# EasyEDA Pro project TEMP_PRO.epro, board PCB_5
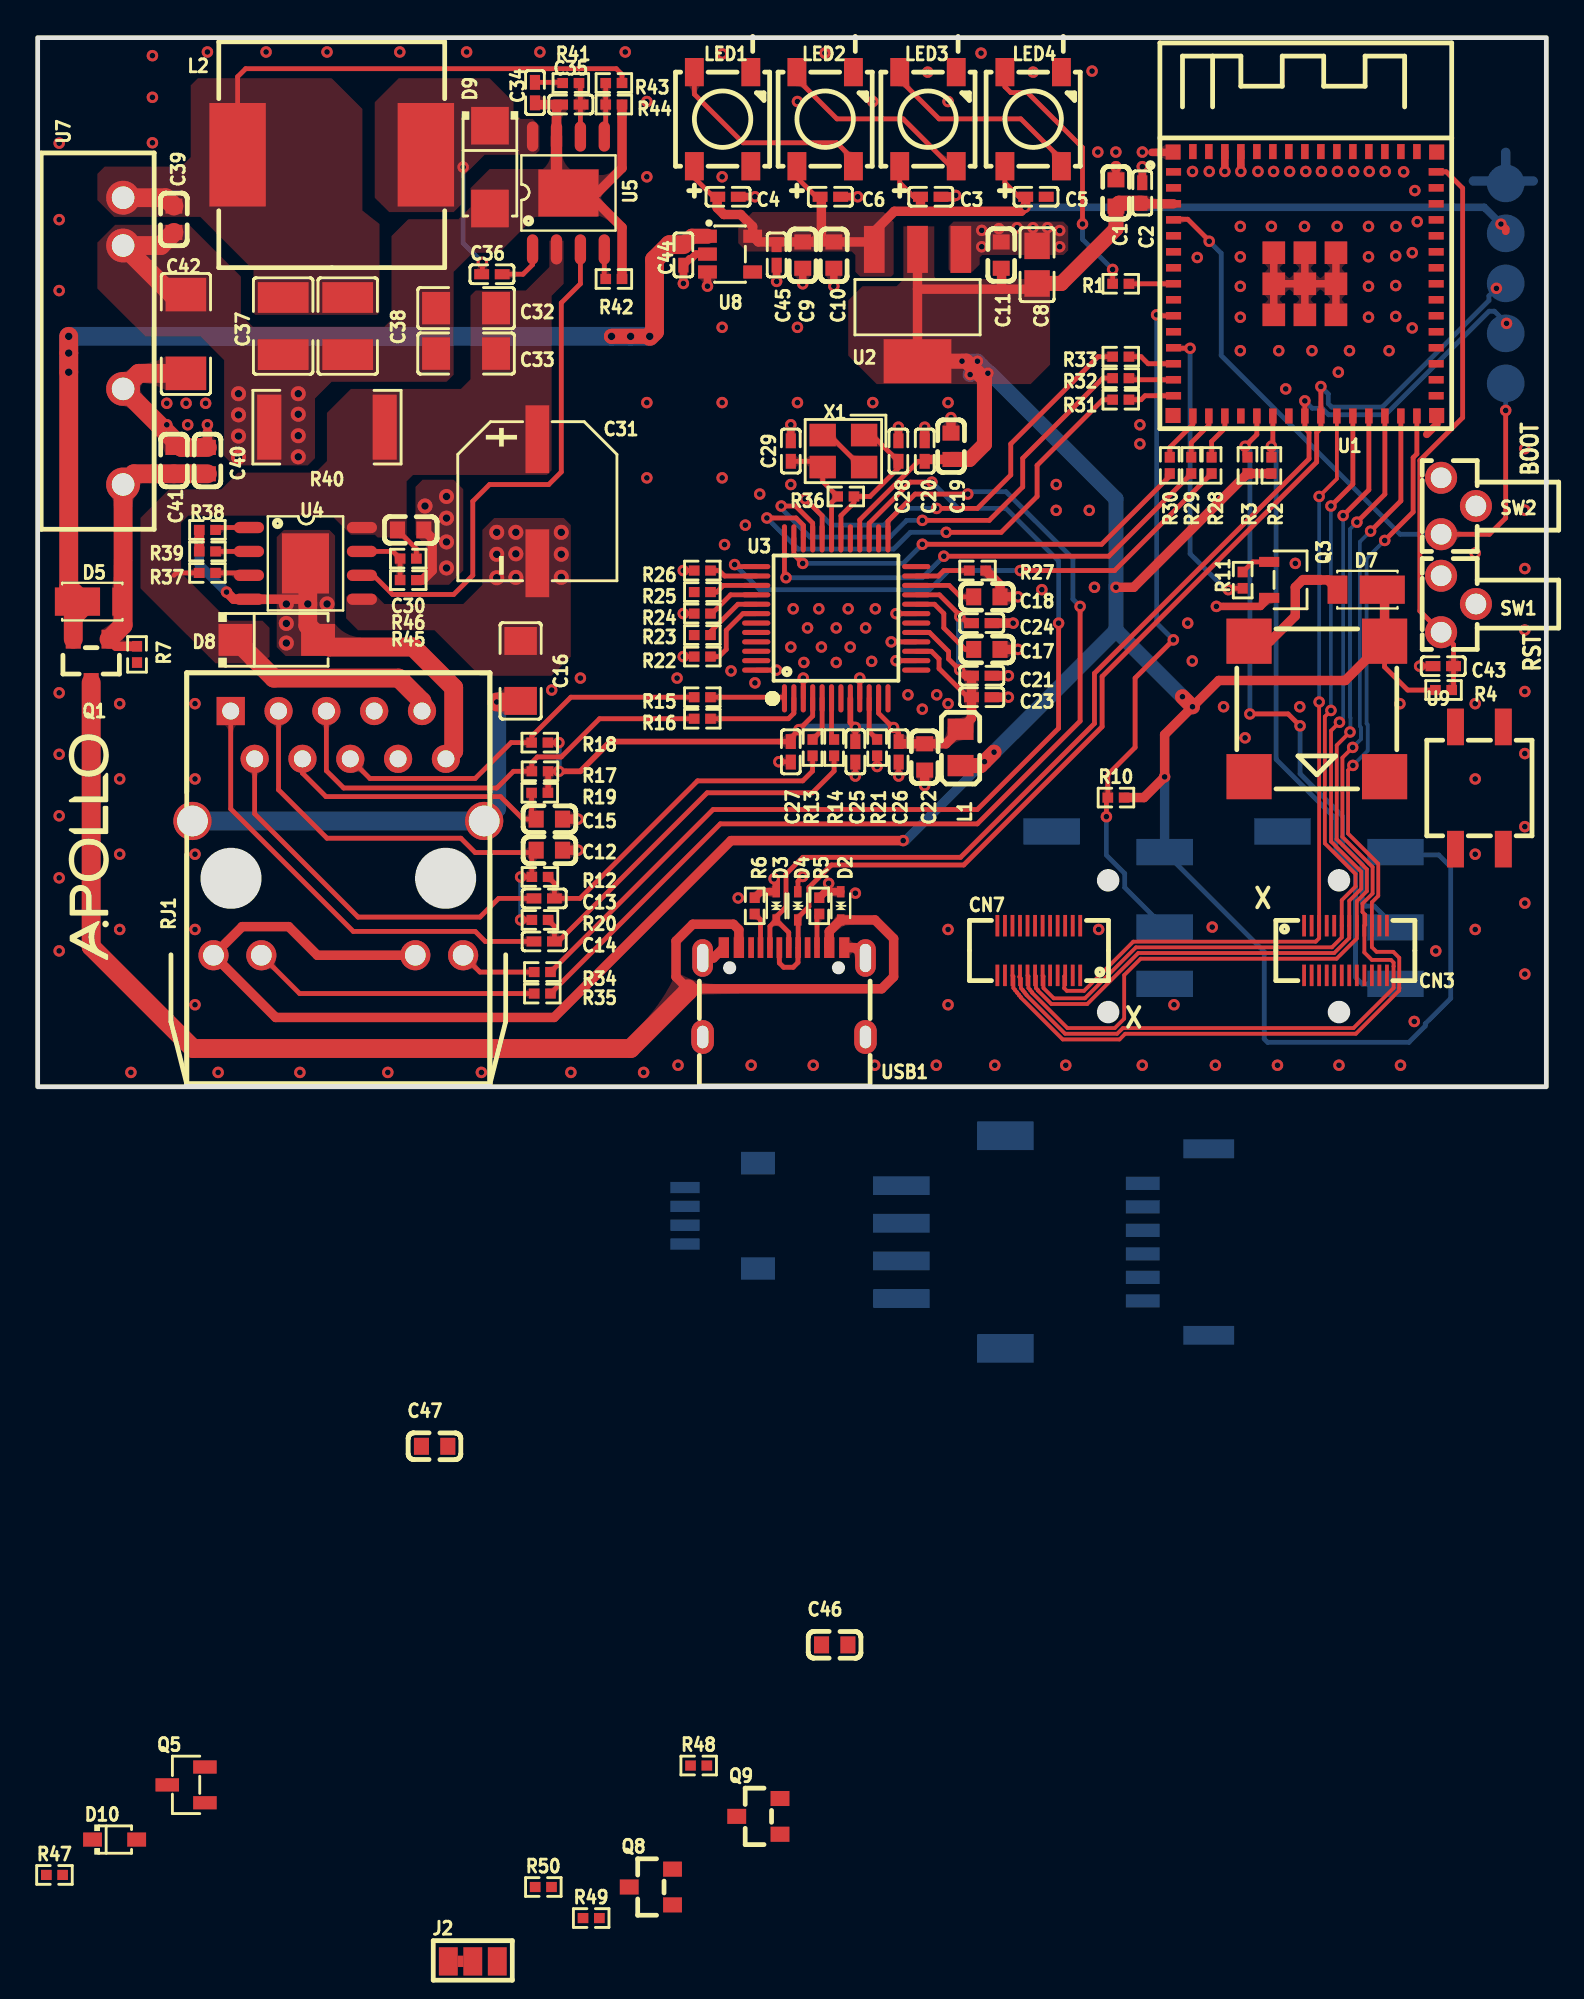
[diagram p3: board, top side]
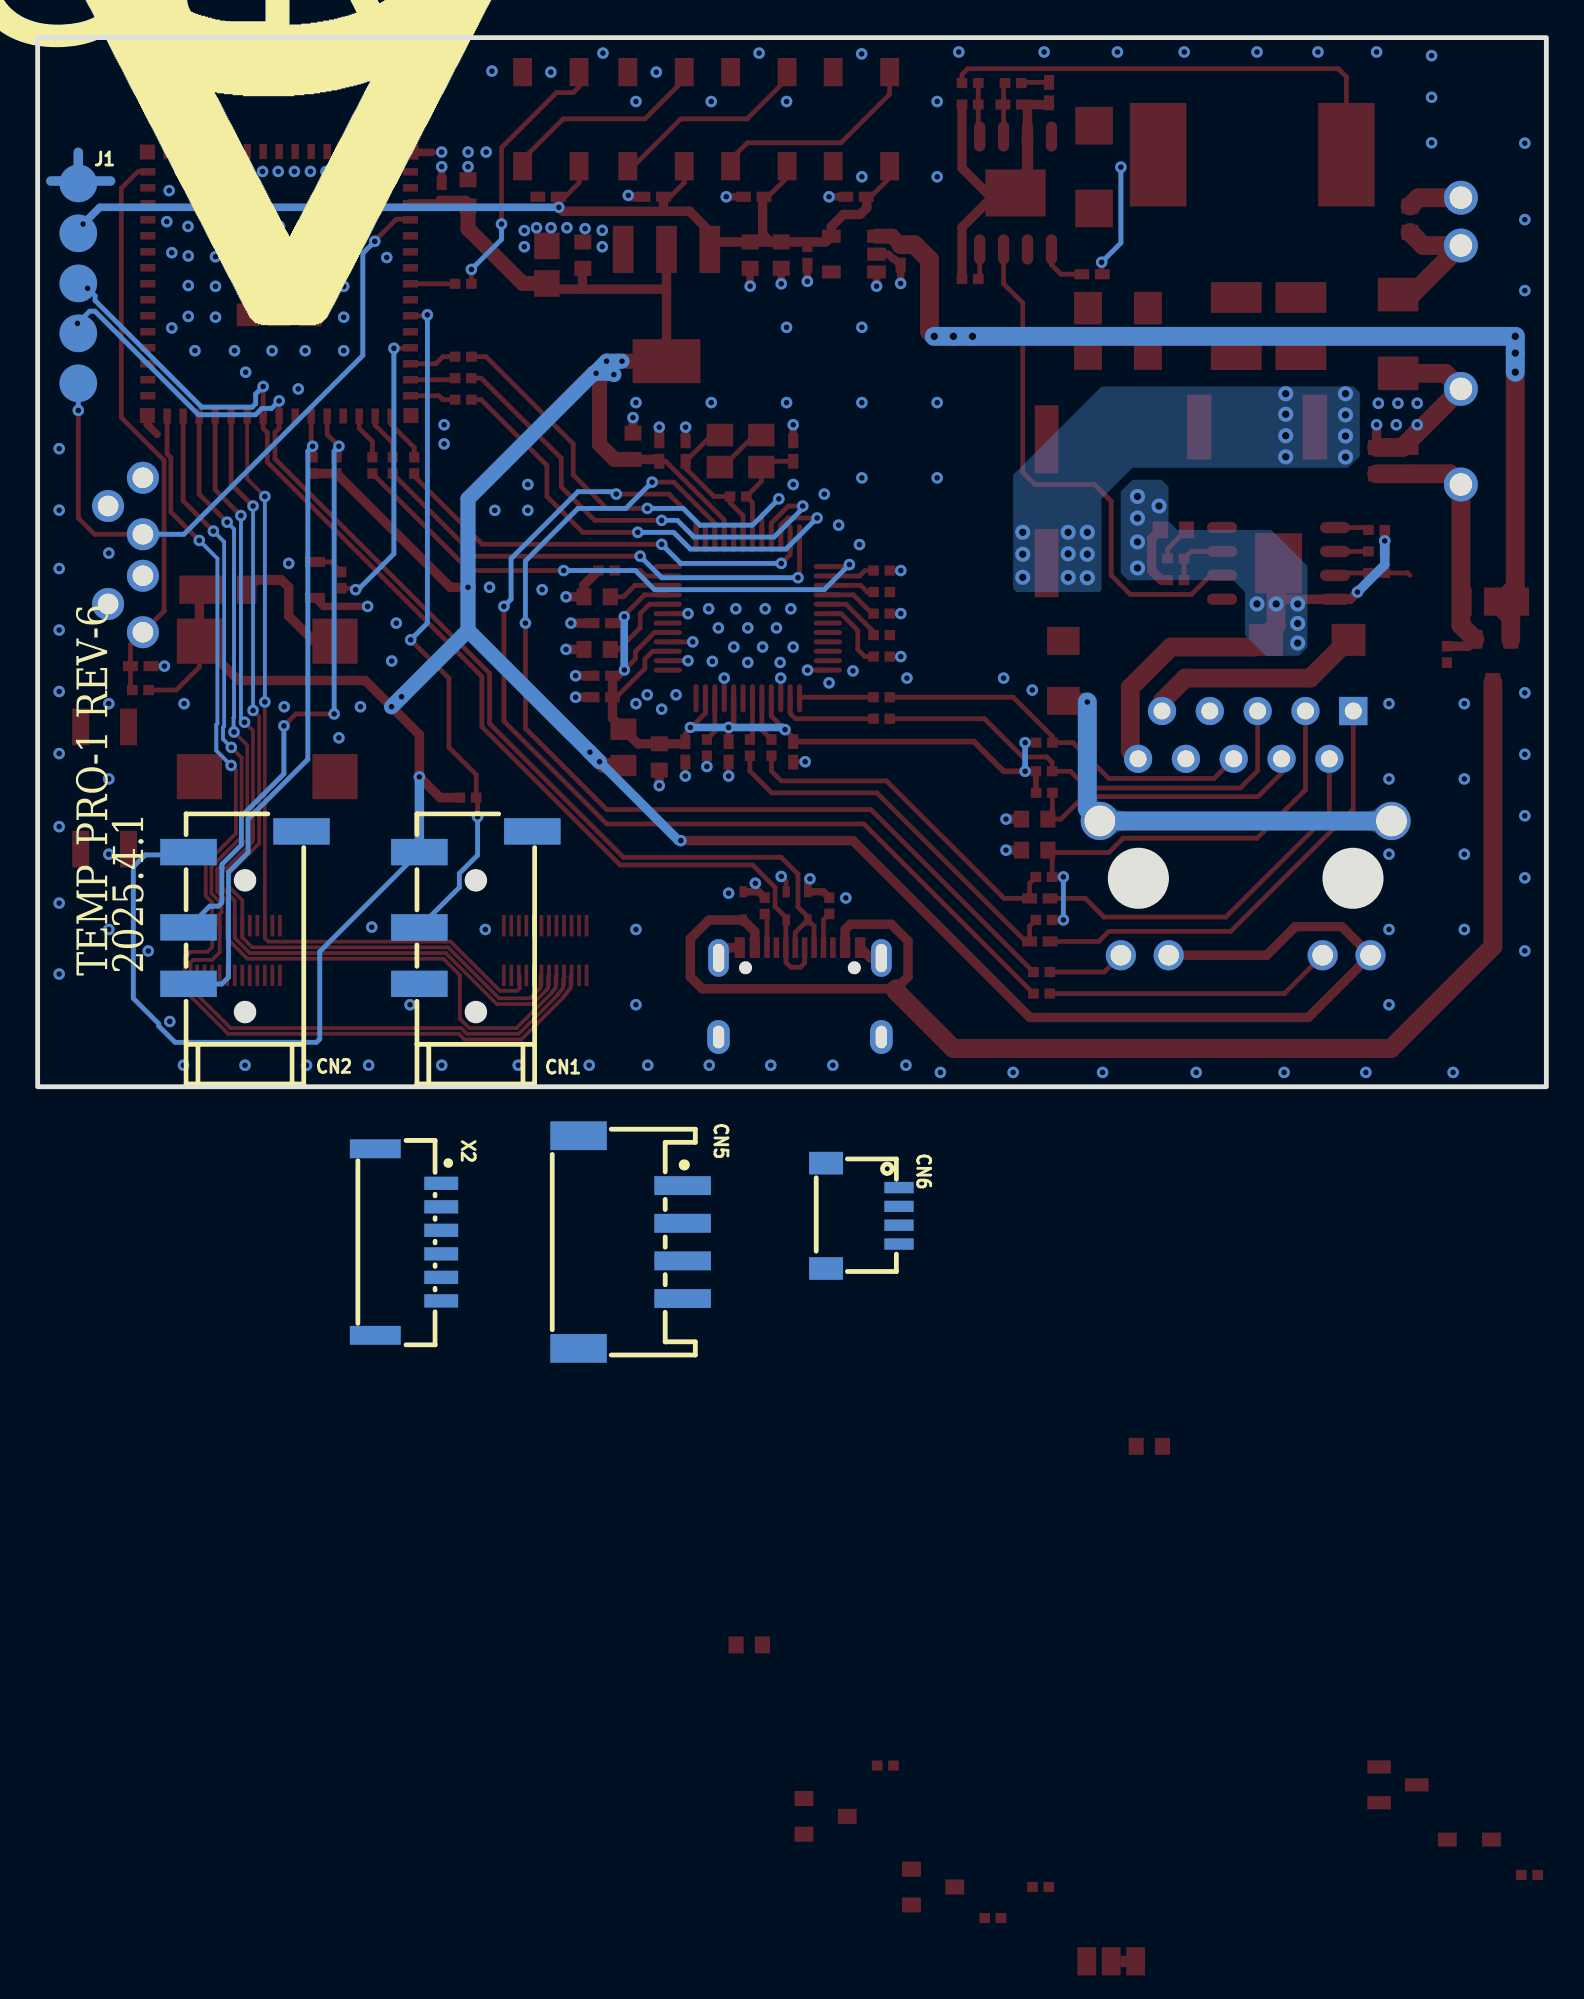
[diagram p4: board, bottom side, seen from below]

Outline 80.14 x 55.75 mm; copper layers: Top Layer, Bottom Layer. Coordinates in mm from the lower left corner of the outline.
Outline path: rectangle 0,55.75 80.14,0
Stack: Top Layer 0.035mm / Dielectric1 1.51mm FR4 er 4.5 / Bottom Layer 0.035mm

## Design rules (mm)
net IO_USBD-: DP1
net IO_USBD+: DP1
template: JLCPCB Capability(Two Layers Board)
spacing copperThickness1oz (default): track to track 0.102, other pairs 0.152 to 0.3
spacing copperThickness2oz: track to track 0.203, other pairs 0.152 to 0.3
track width copperThickness1oz (default): min 0.127, default 0.254, max 2.54
track width copperThickness2oz: min 0.203, default 0.254, max 2.54
differential pair differentialPair (default): width min 0.127, default 0.254, max 2.54; gap min 0.152, default 0.152
via viaSize (default): diameter min 0.5, default 0.61, max 10; hole min 0.3, default 0.305, max 6.3

## Placement (name value [footprint] x y rotation side)
BUZZER1  2700Hz  [BUZ-SMD_4P-L8.5-W8.5-P8.50-BR]  67.94 20.08 180 top
C1  10uF  [C0603]  57.28 47.5 270 top
C2  100nF  [C0402]  58.67 47.5 270 top
C3  100nF  [C0402]  47.44 47.3 0 top
C4  100nF  [C0402]  36.67 47.3 0 top
C5  100nF  [C0402]  53.03 47.3 0 top
C6  100nF  [C0402]  42.1 47.3 0 top
C8  22uF  [C0805]  53.09 43.69 270 top
C9  10uF  [C0603]  40.64 44.2 90 top
C10  10uF  [C0603]  42.29 44.2 90 top
C11  10uF  [C0603]  51.18 44.2 270 top
C12  10nF  [C0603]  27.18 12.57 180 top
C13  6.8nF  [C0402]  26.91 10.01 180 top
C14  6.8nF  [C0402]  26.91 7.72 180 top
C15  22nF  [C0603]  27.18 14.22 180 top
C16  1nF  [C1206]  25.65 22.1 90 top
C17  4.7uF  [C0603]  50.42 23.24 180 top
C18  10nF  [C0603]  50.42 26.03 180 top
C19  10uF  [C0603]  48.51 34.04 270 top
C20  100nF  [C0402]  47.12 33.78 270 top
C21  100nF  [C0402]  50.15 21.84 180 top
C22  10uF  [C0603]  47.12 17.53 90 top
C23  100nF  [C0402]  50.15 20.7 180 top
C24  100nF  [C0402]  50.15 24.64 180 top
C25  100nF  [C0402]  43.43 17.8 90 top
C26  100nF  [C0402]  45.73 17.8 90 top
C27  100nF  [C0402]  40 17.8 90 top
C28  18pF  [C0402]  45.72 33.78 270 top
C29  18pF  [C0402]  40 33.78 270 top
C30  100nF  [C0603]  19.81 29.59 180 top
C31  22uF  [CAP-SMD_BD8.0-L8.3-W8.3-RD]  26.54 31.11 90 top
C32  2.2uF  [C1206]  22.76 41.38 0 top
C33  2.2uF  [C1206]  22.76 38.96 0 top
C34  10nF  [C0402]  26.42 52.83 90 top
C35  8.2pF  [C0402]  28.32 52.2 0 top
C36  100nF  [C0402]  24.13 43.18 0 top
C37  47uF  [C1210]  13.04 40.43 90 top
C38  47uF  [C1210]  16.47 40.43 90 top
C39  10uF  [C0603]  7.24 46.1 90 top
C40  10uF  [C0603]  9.02 33.27 270 top
C41  10uF  [C0603]  7.24 33.27 270 top
C42  1nF  [C1808]  7.87 40 270 top
C43  1uF  [C0402]  74.66 22.35 0 top
C44  1uF  [C0402]  34.3 44.2 90 top
C45  1uF  [C0402]  39.25 44.2 90 top
C46  100nF  [C0603]  42.34 -29.66 0 top
C47  100nF  [C0603]  21.09 -19.11 0 top
CN1  PJ-320D  [AUDIO-SMD_PJ-320D]  56.86 9.52 0 bottom
CN2  PJ-320D  [AUDIO-SMD_PJ-320D]  69.12 9.52 0 bottom
CN3  DF40C-24DS-0.4V(51)  [CONN-SMD_DF40C-24DS-0.4V51]  69.47 7.24 180 top
CN5  PH2.0-4PWB-WT  [CONN-SMD_2.0-4PWB-WT]  48.64 -8.26 270 bottom
CN6  SM04B-SRSS-TB(LF)(SN)  [CONN-SMD_4P-P1.00_SM04B-SRSS-TB-LF-SN]  36.32 -6.86 270 bottom
CN7  DF40C-24DS-0.4V(51)  [CONN-SMD_DF40C-24DS-0.4V51]  53.18 7.24 0 top
D2  LESD5D5.0CT1G  [SOD-523_L1.2-W0.8-LS1.6-BI]  42.66 9.61 90 top
D3  LESD5D5.0CT1G  [SOD-523_L1.2-W0.8-LS1.6-BI]  39.23 9.61 90 top
D4  LESD5D5.0CT1G  [SOD-523_L1.2-W0.8-LS1.6-BI]  40.37 9.61 90 top
D5  DFLS130L-7  [POWERDI-123_L2.8-W1.8-LS3.7-RD]  3.3 25.78 0 top
D7  DFLS130L-7  [POWERDI-123_L2.8-W1.8-LS3.7-RD]  70.23 26.42 180 top
D8  SMAJ58A-13-F  [SMA_L4.4-W2.6-LS5.0-RD]  12.7 23.75 0 top
D9  SS510  [SMA_L4.3-W2.6-LS5.2-RD]  24.03 48.87 270 top
D10  CUS10S30,H3F  [SOD-323_L1.8-W1.3-LS2.5-RD]  4.09 -40.01 0 top
J1  -  [Programming Pads]  77.98 48.01 180 bottom
J2  -  [Jumper:SolderJumper-3_P1.3mm_Bridged12_Pad1.0x1.5mm]  23.11 -46.48 0 top
L1  UPZ2012E601-2R0TF  [L0805]  49.02 18.03 90 top
L2  18uH  [IND-SMD_L12.0-W12.0_CDRH127NP]  15.62 49.53 180 top
LED1  XL-5050RGBC-WS2812B  [LED-SMD_4P-L5.0-W5.0-BL_XL-5050RGBC]  36.38 51.42 0 top
LED2  XL-5050RGBC-WS2812B  [LED-SMD_4P-L5.0-W5.0-BL_XL-5050RGBC]  41.83 51.42 0 top
LED3  XL-5050RGBC-WS2812B  [LED-SMD_4P-L5.0-W5.0-BL_XL-5050RGBC]  47.29 51.42 0 top
LED4  XL-5050RGBC-WS2812B  [LED-SMD_4P-L5.0-W5.0-BL_XL-5050RGBC]  52.88 51.42 0 top
Q1  SI2333CDS-T1-GE3  [SOT-23_L2.9-W1.3-P1.90-LS2.4-BR]  2.84 22.63 90 top
Q3  BC817  [SOT-23-3_L2.9-W1.4-P1.91-LS2.6-BR]  66.55 26.94 180 top
Q5  CJ2321  [SOT-23-3_L2.9-W1.3-P1.90-LS2.4-BR]  7.88 -37.1 0 top
Q8  2N7002,215  [SOT-23_L2.9-W1.3-P1.90-LS2.4-BR]  32.57 -42.53 0 top
Q9  SI2333CDS-T1-GE3  [SOT-23_L2.9-W1.3-P1.90-LS2.4-BR]  38.28 -38.77 0 top
R1  470Ω  [R0402]  57.53 42.67 0 top
R2  4.7kΩ  [R0402]  65.53 33.02 90 top
R3  4.7kΩ  [R0402]  64.26 33.02 90 top
R4  10kΩ  [R0402]  74.68 21.08 180 top
R5  5.1kΩ  [R0402]  41.52 9.61 270 top
R6  5.1kΩ  [R0402]  38.09 9.61 270 top
R7  10kΩ  [R0402]  5.28 22.98 90 top
R10  4.7kΩ  [R0402]  57.28 15.37 0 top
R11  330Ω  [R0402]  64.01 26.92 270 top
R12  49.9Ω  [R0402]  26.68 11.15 0 top
R13  33Ω  [R0402]  41.16 18.02 90 top
R14  33Ω  [R0402]  42.3 18.02 90 top
R15  33Ω  [R0402]  35.31 20.7 0 top
R16  33Ω  [R0402]  35.31 19.56 0 top
R17  49.9Ω  [R0402]  26.68 16.76 0 top
R18  49.9Ω  [R0402]  26.67 18.29 0 top
R19  10Ω  [R0402]  26.67 15.62 0 top
R20  49.9Ω  [R0402]  26.68 8.86 0 top
R21  12.4kΩ  [R0402]  44.59 18.02 90 top
R22  10kΩ  [R0402]  35.31 22.86 180 top
R23  10kΩ  [R0402]  35.31 24 180 top
R24  10kΩ  [R0402]  35.31 25.15 180 top
R25  10kΩ  [R0402]  35.31 26.29 180 top
R26  10kΩ  [R0402]  35.31 27.43 180 top
R27  10kΩ  [R0402]  49.92 27.43 180 top
R28  22Ω  [R0402]  62.36 33.02 90 top
R29  22Ω  [R0402]  61.28 33.02 90 top
R30  22Ω  [R0402]  60.13 33.02 90 top
R31  22Ω  [R0402]  57.53 36.51 0 top
R32  22Ω  [R0402]  57.53 37.66 0 top
R33  22Ω  [R0402]  57.53 38.8 0 top
R34  470Ω  [R0402]  26.81 6.1 180 top
R35  470Ω  [R0402]  26.81 4.95 180 top
R36  1MΩ  [R0402]  42.93 31.37 180 top
R37  24.9kΩ  [R0402]  9.02 27.3 180 top
R38  180kΩ  [R0402]  9.02 29.59 0 top
R39  4.42kΩ  [R0402]  9.02 28.45 0 top
R40  4.7kΩ  [R2512]  15.37 35.05 180 top
R41  18.7kΩ  [R0402]  28.32 53.34 0 top
R42  274kΩ  [R0402]  30.61 42.93 180 top
R43  60.4kΩ  [R0402]  30.61 53.34 180 top
R44  11.5kΩ  [R0402]  30.61 52.2 180 top
R45  10kΩ  [R0402]  19.69 26.92 180 top
R46  130kΩ  [R0402]  19.69 28.07 0 top
R47  10kΩ  [R0402]  0.89 -41.89 0 top
R48  100kΩ  [R0402]  35.11 -36.07 0 top
R49  100kΩ  [R0402]  29.4 -44.18 0 top
R50  10Ω  [R0402]  26.86 -42.53 0 top
RJ1  HY931147C  [RJ45-TH_HY931147C]  15.97 13.48 90 top
SW1  TSC017A07026A  [SW-TH_3P-L4.5-W7.0-P3.00-LS1.9]  75.47 25.65 90 top
SW2  TSC017A07026A  [SW-TH_3P-L4.5-W7.0-P3.00-LS1.9]  75.47 30.86 90 top
U1  2.4GHz  [BULETM-SMD_ESP32-S3-MINI-1-N8]  67.31 42.67 0 top
U2  AZ1117H-3.3TRE1  [SOT-223-3_L6.5-W3.4-P2.30-LS7.0-BR]  46.74 41.53 90 top
U3  W5500  [LQFP-48_L7.0-W7.0-P0.50-LS9.0-BL]  42.42 24.89 0 top
U4  TPS2376DDAR-H  [SO-8_L4.9-W3.9-P1.27-LS6.0-BL-EP]  14.22 27.81 270 top
U5  TPS54560BDDAR  [POWERPAD-SO-8_L4.9-W3.9-P1.27-LS6.0-BL-EP]  28.19 47.5 0 top
U7  F0505S-2WR2  [PWRM-TH_FXXXXS-1WR2]  4.54 39.63 270 top
U8  NCV360SNT1G  [TSOP-5_L3.0-W1.5-P0.95-LS2.8-BL]  36.78 44.25 270 top
U9  HC-PM254-8.5H-2x2PS  [HDR-SMD_4P-P2.54-V-F-R2-C2-LS6.8]  76.58 15.87 0 top
USB1  TYPE-C16PIN2MD(073)  [USB-C-SMD_TYPE-C-6PIN-2MD-073]  39.65 5.02 0 top
X1  25MHz  [CRYSTAL-SMD_4P-L3.2-W2.5-BL]  42.8 33.78 180 top
X2  GH125-S06DCA-00  [CONN-SMD_6P-P1.25_JUSHUO_GH125-S06DCA-00]  60.45 -8.26 270 bottom

## Footprints (pads in the part's own frame, mm; a bottom-side part is the same pattern mirrored in y, then rotated)
AUDIO-SMD_PJ-320D
  rect 3x1.4 smd: 1(-3,-4.05) 2(3,4.05) 3(3,1.05) 4(3,-2.95)
BULETM-SMD_ESP32-S3-MINI-1-N8
  rect 0.8x0.4 smd: 1(-6.975,5.95) 2(-6.975,5.1) 3(-6.975,4.25) 4(-6.975,3.4) 5(-6.975,2.55) 6(-6.975,1.7) 7(-6.975,0.85) 8(-6.975,0) 9(-6.975,-0.85) 10(-6.975,-1.7) 11(-6.975,-2.55) 12(-6.975,-3.4) 13(-6.975,-4.25) 14(-6.975,-5.1) 15(-6.975,-5.95) 31(6.975,-5.95) 32(6.975,-5.1) 33(6.975,-4.25) 34(6.975,-3.4) 35(6.975,-2.55) 36(6.975,-1.7) 37(6.975,-0.85) 38(6.975,0) 39(6.975,0.85) 40(6.975,1.7) 41(6.975,2.55) 42(6.975,3.4) 43(6.975,4.25) 44(6.975,5.1) 45(6.975,5.95)
  rect 0.4x0.8 smd: 16(-5.95,-7.025) 17(-5.1,-7.025) 18(-4.25,-7.025) 19(-3.4,-7.025) 20(-2.55,-7.025) 21(-1.7,-7.025) 22(-0.85,-7.025) 23(0,-7.025) 24(0.85,-7.025) 25(1.7,-7.025) 26(2.55,-7.025) 27(3.4,-7.025) 28(4.25,-7.025) 29(5.1,-7.025) 30(5.95,-7.025) 46(5.95,7.025) 47(5.1,7.025) 48(4.25,7.025) 49(3.4,7.025) 50(2.55,7.025) 51(1.7,7.025) 52(0.85,7.025) 53(0,7.025) 54(-0.85,7.025) 55(-1.7,7.025) 56(-2.55,7.025) 57(-3.4,7.025) 58(-4.25,7.025) 59(-5.1,7.025) 60(-5.95,7.025)
  rect 0.8x0.8 smd: GND(-7,7) GND(-7,-7) GND(7,7) GND(7,-7)
  rect 1.2x1.2 smd: GND(-1.65,1.65) GND(-1.65,0) GND(-1.65,-1.65) GND(0,1.65) GND(0,0) GND(0,-1.65) GND(1.65,1.65) GND(1.65,0) GND(1.65,-1.65)
BUZ-SMD_4P-L8.5-W8.5-P8.50-BR
  rect 2.4x2.4 smd: 1(-3.6,-3.6) 2(3.6,-3.6) 3(3.599,3.599) 4(-3.6,3.6)
C0402
  rect 0.79x0.54 smd: 1(-0.545,0) 2(0.545,0)
C0603
  rect 0.8x0.9 smd: 1(-0.7,0) 2(0.7,0)
C0805
  rect 1.41x1.35 smd: 1(-1,0) 2(1,0)
C1206
  rect 1.485x1.728 smd: 1(-1.593,0) 2(1.593,0)
C1210
  rect 1.635x2.7 smd: 1(-1.518,0) 2(1.518,0)
C1808
  rect 1.785x2.16 smd: 1(-2.092,0) 2(2.092,0)
CAP-SMD_BD8.0-L8.3-W8.3-RD
  rect 3.61x1.26 smd: 1(3.295,0) 2(-3.295,0)
CONN-SMD_2.0-4PWB-WT
  rect 1x3 smd: 1(-3,2.763) 2(-1,2.763) 3(1,2.763) 4(3,2.763)
  rect 1.524x3 smd: 5(-5.65,-2.763) 6(5.65,-2.763)
CONN-SMD_4P-P1.00_SM04B-SRSS-TB-LF-SN
  rect 0.6x1.55 smd: 1(-1.5,1.938) 2(-0.5,1.938) 3(0.5,1.938) 4(1.5,1.938)
  rect 1.2x1.8 smd: 5(2.8,-1.938) 6(-2.8,-1.938)
CONN-SMD_6P-P1.25_JUSHUO_GH125-S06DCA-00
  rect 0.7x1.8 smd: 1(-3.125,1.75) 2(-1.875,1.75) 3(-0.625,1.75) 4(0.625,1.75) 5(1.875,1.75) 6(3.125,1.75)
  rect 1x2.7 smd: 7(4.955,-1.75) 8(-4.955,-1.75)
CONN-SMD_DF40C-24DS-0.4V51
  rect 0.2x1.14 smd: 1(2.2,-1.32) 2(2.2,1.32) 3(1.8,-1.32) 4(1.8,1.32) 5(1.4,-1.32) 6(1.4,1.32) 7(1,-1.32) 8(1,1.32) 9(0.6,-1.32) 10(0.6,1.32) 11(0.2,-1.32) 12(0.2,1.32) 13(-0.2,-1.32) 14(-0.2,1.32) 15(-0.6,-1.32) 16(-0.6,1.32) 17(-1,-1.32) 18(-1,1.32) 19(-1.4,-1.32) 20(-1.4,1.32) 21(-1.8,-1.32) 22(-1.8,1.32) 23(-2.2,-1.32) 24(-2.2,1.32)
CRYSTAL-SMD_4P-L3.2-W2.5-BL
  rect 1.4x1.2 smd: 1(-1.1,-0.85) 2(1.1,-0.85) 3(1.1,0.85) 4(-1.1,0.85)
HDR-SMD_4P-P2.54-V-F-R2-C2-LS6.8
  rect 0.9x1.945 smd: 1(-1.27,-3.248) 2(-1.27,3.248) 3(1.27,-3.248) 4(1.27,3.248)
IND-SMD_L12.0-W12.0_CDRH127NP
  rect 3x5.5 smd: 1(-5,0) 2(5,0)
Jumper:SolderJumper-3_P1.3mm_Bridged12_Pad1.0x1.5mm
  custom 0.3x0.6 smd: (-0.65,0)
  custom 1x1.5 smd: 1(-1.3,0) 2(0,0) 3(1.3,0)
L0805
  rect 1.133x1.377 smd: 1(-0.966,0) 2(0.966,0)
LED-SMD_4P-L5.0-W5.0-BL_XL-5050RGBC
  rect 1x1.5 smd: 1(-1.5,-2.5) 2(1.5,-2.5) 3(1.5,2.5) 4(-1.5,2.5)
LQFP-48_L7.0-W7.0-P0.50-LS9.0-BL
  oval 0.27x1.5 smd: 1(-2.75,-4.25) 2(-2.25,-4.25) 3(-1.75,-4.25) 4(-1.25,-4.25) 5(-0.75,-4.25) 6(-0.25,-4.25) 7(0.25,-4.25) 8(0.75,-4.25) 9(1.25,-4.25) 10(1.75,-4.25) 11(2.25,-4.25) 12(2.75,-4.25) 25(2.75,4.25) 26(2.25,4.25) 27(1.75,4.25) 28(1.25,4.25) 29(0.75,4.25) 30(0.25,4.25) 31(-0.25,4.25) 32(-0.75,4.25) 33(-1.25,4.25) 34(-1.75,4.25) 35(-2.25,4.25) 36(-2.75,4.25)
  oval 1.5x0.27 smd: 13(4.25,-2.75) 14(4.25,-2.25) 15(4.25,-1.75) 16(4.25,-1.25) 17(4.25,-0.75) 18(4.25,-0.25) 19(4.25,0.25) 20(4.25,0.75) 21(4.25,1.25) 22(4.25,1.75) 23(4.25,2.25) 24(4.25,2.75) 37(-4.25,2.75) 38(-4.25,2.25) 39(-4.25,1.75) 40(-4.25,1.25) 41(-4.25,0.75) 42(-4.25,0.25) 43(-4.25,-0.25) 44(-4.25,-0.75) 45(-4.25,-1.25) 46(-4.25,-1.75) 47(-4.25,-2.25) 48(-4.25,-2.75)
POWERDI-123_L2.8-W1.8-LS3.7-RD
  rect 2.4x1.5 smd: 1(-1.188,0)
  rect 1.05x1.5 smd: 2(1.188,0)
POWERPAD-SO-8_L4.9-W3.9-P1.27-LS6.0-BL-EP
  oval 0.6x1.6 smd: 1(-1.905,-3) 2(-0.635,-3) 3(0.635,-3) 4(1.905,-3) 5(1.905,3) 6(0.635,3) 7(-0.635,3) 8(-1.905,3)
  rect 3.2x2.5 smd: 9(0,0)
Programming Pads
  round 2 smd: 1(0,0) 2(0,-2.653) 3(0,-5.312) 4(0,-7.968) 5(0,-10.624)
PWRM-TH_FXXXXS-1WR2
  round 1.8 hole 1.2: 1(-7.62,0) 2(-5.08,0) 5(2.54,0) 7(7.62,0)
R0402
  rect 0.566x0.54 smd: 1(-0.433,0) 2(0.433,0)
R2512
  rect 1.282x3.456 smd: 1(-3.067,0) 2(3.067,0)
RJ45-TH_HY931147C
  rect 1.5x1.5 hole 0.9: 1(6.489,5.715)
  round 1.5 hole 0.9: 2(3.95,4.445) 3(6.489,3.175) 4(3.95,1.905) 5(6.489,0.635) 6(3.95,-0.635) 7(6.489,-1.905) 8(3.95,-3.175) 9(6.489,-4.445) 10(3.95,-5.715)
  round 1.6 hole 1.1: 11(-6.489,6.63) 12(-6.489,4.09) 13(-6.489,-4.09) 14(-6.489,-6.63)
  round 2.03 hole 1.631: GND1(0.647,7.747) GND2(0.647,-7.747)
SMA_L4.3-W2.6-LS5.2-RD
  rect 2x2 smd: 1(-2.2,0) 2(2.2,0)
SMA_L4.4-W2.6-LS5.0-RD
  rect 1.8x1.7 smd: 1(-2.192,0) 2(2.192,0)
SO-8_L4.9-W3.9-P1.27-LS6.0-BL-EP
  oval 0.6x1.6 smd: 1(-1.905,-3) 2(-0.635,-3) 3(0.635,-3) 4(1.905,-3) 5(1.905,3) 6(0.635,3) 7(-0.635,3) 8(-1.905,3)
  rect 3.2x2.5 smd: 9(0,0)
SOD-323_L1.8-W1.3-LS2.5-RD
  rect 1x0.75 smd: 1(-1.173,0) 2(1.173,0)
SOD-523_L1.2-W0.8-LS1.6-BI
  rect 0.6x0.4 smd: 1(-0.75,0) 2(0.75,0)
SOT-23-3_L2.9-W1.3-P1.90-LS2.4-BR
  rect 1.25x0.7 smd: 1(1,-0.95) 2(1,0.95) 3(-1,0)
SOT-23-3_L2.9-W1.4-P1.91-LS2.6-BR
  rect 1.07x0.532 smd: 1(1.135,-0.955) 2(1.135,0.955) 3(-1.135,0)
SOT-23_L2.9-W1.3-P1.90-LS2.4-BR
  rect 1x0.8 smd: 1(1.15,-0.95) 2(1.15,0.95) 3(-1.15,0)
SOT-223-3_L6.5-W3.4-P2.30-LS7.0-BR
  rect 2.5x1.1 smd: 1(2.97,-2.3) 2(2.97,0) 3(2.97,2.3)
  rect 2.34x3.6 smd: 4(-2.97,0)
SW-TH_3P-L4.5-W7.0-P3.00-LS1.9
  round 1.7 hole 1.1: 1(-1.5,0.925) 2(1.5,0.925) 3(0,-0.925)
TSOP-5_L3.0-W1.5-P0.95-LS2.8-BL
  rect 0.7x1 smd: 1(-0.95,-1.2) 2(0,-1.2) 3(0.95,-1.2) 4(0.95,1.2) 5(-0.95,1.2)
USB-C-SMD_TYPE-C-6PIN-2MD-073
  rect 0.55x1.1 smd: 1(-3.2,2.375) 2(-2.4,2.375) 11(2.4,2.375) 12(3.2,2.375)
  rect 0.3x1.1 smd: 3(-1.75,2.375) 4(-1.25,2.375) 5(-0.75,2.375) 6(-0.25,2.375) 7(0.25,2.375) 8(0.75,2.375) 9(1.25,2.375) 10(1.75,2.375)
  oval 1.1x2 hole 0.6x1.5: 13(-4.325,1.825) 14(4.325,1.825)
  oval 1.2x1.8 hole 0.6x1.2: 13(-4.325,-2.375) 14(4.325,-2.375)

## Nets
As in the schematic, except:
$2N19568: R39.2 U4.2

Pads without a net: BUZZER1 3 4; CN1 1; CN3 6 7 8 12 14 16 18 20 22; CN5 5 6; CN7 6 7 8 12 14 16 18 20 22; LED1 2; RJ1 7 8; U1 5 6 7 9 19 22 31 32 33 34 35 36 37 38 39 40 41 44; U3 7 12 13 18 24 26 43 44 45 46 47; U8 4; USB1 3 9; X2 6 7 8

## Via types
v1: diameter 0.61, hole 0.305, Top Layer to Bottom Layer, 294 vias
v2: diameter 0.6, hole 0.3, Top Layer to Bottom Layer, 6 vias
v3: diameter 0.8, hole 0.4, Top Layer to Bottom Layer, 33 vias

## Routing (per net, layer and track width the routed paths; a pad name or vN(x,y) marks a point on that pad's centre or on a via; arc(x,y) is an arc through that point)
+3V3_CTRL: length 270.2
  Top Layer w0.254: LED4.1 51.38,48.92 51.38,48.04 52.12,47.3 C5.1 ; C3.1 46.53,47.3 45.79,48.04 LED3.1 ; 47.12,33.24 46.78,33.24 43.67,30.12 43.67,29.14 ; C4.1 35.89,47.3 34.88,48.3 LED1.1 ; 74.24,21.08 72.77,21.08 71.54,22.31 71.54,23.68 ; LED2.1 40.33,48.32 41.35,47.3 C6.1
  Top Layer w0.4: v2(77.72,45.85) 77.98,45.59 77.98,45.46
  Top Layer w0.5: 20.06,6.99 14.86,6.99 13.34,8.51 10.86,8.51 9.34,6.99 12.64,3.68 27.43,3.68 36.83,13.08 v1(45.97,13.08) ; 46.74,44.5 46.74,42.39 ; 46.74,42.39 46.74,38.56 ; 46.74,42.39 51.2,42.39 ; 51.2,42.39 52.78,42.39 53.09,42.69 ; 51.2,42.39 51.2,43.48 51.18,43.5 ; C3.1 46.89,46.53 46.9,46.52 ; 41.21,44.9 41.63,45.31 41.63,47.23 C6.1 ; 41.21,44.9 44.04,44.9 44.44,44.5 44.44,45.45 45.51,46.52 46.9,46.52 ; 41.21,44.9 38.28,44.9 37.98,45.2 37.98,45.71 37.34,46.35 36.45,46.35 36.1,46.71 36.1,47.27 C4.1 ; 46.9,46.52 52.24,46.52 v2(52.45,46.74) ; 65.53,32.59 64.26,32.59 58.22,26.54 v1(57.28,26.54) ; 60.34,46.92 58.71,46.92 58.67,46.95 ; D7.1 71.54,26.29 71.54,23.68 69.46,21.59 62.74,21.59 v1(61.34,20.19) 59.86,18.71 v1(59.86,16.47) 58.76,15.37 R10.2 ; 52.48,46.98 C5.1 ; 48.51,33.34 47.22,33.34 47.12,33.24
  Top Layer w0.8: v1(60.81,20.73) v1(61.34,20.19) ; v1(50.8,17.78) v1(50.29,17.27) 50.09,17.07 49.02,17.07 ; 53.09,42.69 54.37,42.69 57.28,45.59 57.28,46.8 57.43,46.95 58.67,46.95 ; 48.51,33.34 49.49,33.34 50.29,34.14 50.29,37.59 49.32,38.56 46.74,38.56
  Bottom Layer w0.254: 72.12,12.47 72.27,12.32 74.42,12.32 75.06,11.68 75.06,4.7 73.7,3.35 73.7,3.23 72.84,2.36 65.33,2.36 65.15,2.54 65.15,7.18 59.86,12.47
  Bottom Layer w0.4: v2(52.45,46.74) 76.84,46.74 v2(77.72,45.85)
  Bottom Layer w0.5: v1(50.29,17.27) 46.1,13.08 v1(45.97,13.08) ; v1(59.86,16.47) 59.86,12.47
  Bottom Layer w0.8: v1(50.29,17.27) v1(50.8,17.78) 57.28,24.26 ; v1(50.47,37.92) 49.6,37.92 v1(49.53,37.85) ; v1(50.47,37.92) 50.6,37.92 57.28,31.24 v1(57.28,26.54) 57.28,24.26 ; v1(50.47,37.92) 50.47,38 v1(49.92,38.56) v1(49.1,38.56) ; 57.28,24.26 v1(60.81,20.73) v1(61.34,20.19)
+3V3A: length 51.3
  Top Layer w0.254: R17.2 v1(27.69,16.76) ; C26.2 45.73,18.78 44.67,19.85 U3.11 ; U3.4 41.17,19.7 v1(40.44,18.98) 40,18.54 C27.2 ; C24.2 49.4,24.64 47.9,26.14 U3.21 ; U3.15 47.47,23.14 47.88,22.73 47.88,22.22 49.4,20.7 C23.2 ; U3.17 47.37,24.14 48.39,23.12 48.39,22.73 v2(48.97,22.15) ; R18.2 v1(27.69,18.29)
  Top Layer w0.3: C25.2 v1(43.43,19.09) 43.17,19.36 U3.8 ; C27.2 30.41,18.34 28.83,16.76 v1(27.69,16.76) ; R19.2 27.11,15.63 R17.2
  Top Layer w0.4: C21.2 49.28,21.84 v2(48.97,22.15)
  Top Layer w0.5: C26.2 45.85,18.23 C22.2 48.25,18.23 L1.2 49.6,19.58 C23.2 C21.2
  Bottom Layer w0.3: v1(27.69,18.29) v1(27.69,16.76)
  Bottom Layer w0.4: v1(40.44,18.98) 40.56,19.09 v1(43.43,19.09) v2(45.47,19.09) ; v2(48.98,24.98) 48.98,22.16 v2(48.97,22.15)
+5V_OUT: length 59.1
  Top Layer w0.8: v3(32.51,39.88) v3(31.5,39.88) v3(30.48,39.88) ; C44.2 34.75,45.2 U8.1
  Top Layer w1: v3(1.65,39.88) v3(1.65,38.99) v3(1.65,37.97) 1.65,26.56 2.57,25.64 1.89,24.97 1.89,23.78 ; C44.2 33.57,44.75 32.77,43.95 32.77,40.13 v3(32.51,39.88)
  Bottom Layer w1: v3(32.51,39.88) v3(31.5,39.88) v3(30.48,39.88) v3(1.65,39.88) v3(1.65,38.99) v3(1.65,37.97)
+5V_POE: length 14.9
  Top Layer w0.5: R7.2 4.17,23.41 Q1.1
  Top Layer w1: C40.2 C41.2 5.11,32.57 U7.7 4.54,24.53 Q1.1
+5V_USB: length 75.1
  Top Layer w0.5: USB1.11 42.05,8.25 D2.1 44.48,8.86 45.47,7.87 45.47,5.84 44.83,5.21 34.54,5.21 33.91,5.84 33.91,7.75 34.8,8.64 36.96,8.64 37.25,8.35 USB1.2
  Top Layer w1: 2.84,21.48 2.84,7.44 8.25,2.03 31.5,2.03 34.54,5.08 34.54,5.21
+5VA: length 28.2
  Top Layer w0.254: L2.2 10.62,53.67 11.05,54.1 30.73,54.1 31.04,53.8 R43.1
  Top Layer w1: C39.2 6.79,47.25 U7.1
AGND: length 26
  Top Layer w0.5: 29.21,47.5 U5.9 ; 29.21,47.5 29.72,47.5 31.04,48.82 R44.1 ; 29.21,47.5 31.04,45.67 R42.1 ; U5.7 27.56,51.98 C35.1 26.51,52.2 C34.1
  Top Layer w0.6: U5.9 27.56,48.13 U5.7
  Top Layer w1: C39.1 6.54,44.71 U7.2 7.15,42.1 C42.1
  vias: v3(10.67,36.83) v3(10.67,35.71) v3(10.67,34.58) v3(10.67,33.46) v3(13.84,36.83) v3(13.84,35.74) v3(13.84,34.6) v3(13.84,33.48) v3(24.38,29.46) v3(24.38,28.3) v3(24.38,27.05) v3(25.4,29.46) v3(25.4,28.32) v3(25.4,27.07) v3(27.81,29.46) v3(27.81,28.3) v3(27.81,27.07)
GND: length 79.5
  Top Layer w0.254: X1.2 42.06,34.63 43.76,32.93 X1.4 ; v1(39.37,17.27) 39.99,17.27 C27.1 ; U3.16 v1(45.34,23.64) ; R21.1 v1(44.59,17.02) ; R24.2 v1(34.29,25.15) ; v1(40.64,11.18) 40.39,10.92 40.39,10.38 D4.2 ; U3.48 v1(39.24,22.14) ; U3.9 v1(43.67,21.72) ; C25.1 v1(43.43,16.51) ; U3.19 v1(45.59,25.14) ; C43.1 v1(73.41,22.35) ; R22.2 v1(34.29,22.86) ; C26.1 v1(45.73,16.51) ; R26.2 v1(34.29,27.43) ; U3.3 v1(40.67,21.72) ; U3.14 v1(45.59,22.64)
  Top Layer w0.4: U1.GND U1.GND ; U1.GND U1.GND ; U1.GND U1.GND ; U1.GND U1.GND ; U1.GND U1.GND ; U1.GND U1.GND ; C9.1 v1(40.64,42.67) ; 59.18,49.66 60.3,49.66 U1.GND ; U1.GND U1.GND ; U1.GND U1.GND ; U1.57 v1(63.91,48.64) ; Q3.2 64.96,25.53 v1(62.61,25.53) ; 42.65,47.3 v1(43.56,47.3) ; R5.1 41.83,10.36 D2.2 ; v1(39.12,11.05) 39.23,10.93 D3.2 38.4,10.36 R6.1 ; U8.3 v1(35.58,42.54) ; U1.58 v1(63.06,48.64) ; U8.2 34.96,44.25 34.71,44 34.64,44 C44.1 v1(34.3,42.69) ; C28.1 v1(45.72,35.05) ; 73.79,34.67 74.31,35.19 U1.GND ; C10.1 v1(42.29,42.54) ; C2.1 v1(58.67,48.89) ; C45.1 v1(39.25,42.8) ; C29.1 v1(40,35.18) ; C1.1 v1(57.28,48.89) ; C4.2 v1(38.1,47.3)
  Top Layer w0.5: C17.1 v1(52.07,23.24) ; R27.1 51.12,26.67 C18.1 v1(52.07,26.03) ; C20.1 v1(47.12,35.05) ; 27.88,12.57 v1(28.7,12.57) ; C23.1 v1(51.56,20.7) ; C24.1 v1(51.82,24.64) ; USB1.13 35.9,6.84 USB1.1 ; v2(48.77,47.37) 48.69,47.3 47.98,47.3 ; C19.1 v1(48.51,35.56) ; USB1.12 43.42,7.39 USB1.14 ; 27.88,14.22 v1(28.7,14.22) ; C22.1 v1(47.12,16) ; C21.1 v1(51.56,21.84) ; C40.1 9.02,34.8
  Top Layer w1: C42.2 5.37,37.91 U7.5 7.65,33.97 C40.1
  Bottom Layer w0.5: J1.1 77.98,48.13 ; 77.98,48.13 77.98,49.66 ; 77.98,48.13 79.44,48.13 ; 77.98,48.13 76.26,48.13
  vias: v1(1.14,50.14) v1(1.14,46.08) v1(1.14,42.31) v1(1.14,20.93) v1(1.14,17.67) v1(1.14,14.4) v1(1.14,11.1) v1(1.14,7.22) v1(4.36,20.36) v1(4.36,16.36) v1(4.36,12.36) v1(4.36,8.36) v1(4.95,0.76) v1(6.1,54.79) v1(6.1,52.58) v1(6.1,50.16) v1(6.86,36.32) v1(6.86,35.18) v1(7.88,36.32) v1(7.97,35.18) v1(8.36,20.36) v1(8.36,16.36) v1(8.36,12.36) v1(8.36,8.36) v1(8.36,4.36) v1(8.92,36.32) v1(9.02,54.99) v1(9.02,35.18) v1(9.59,0.76) v1(12.13,54.99) v1(13.93,0.76) v1(15.37,54.99) v1(18.6,0.76) v1(19.23,54.99) v1(22.78,54.99) v1(23.57,0.76) v1(26.68,54.99) v1(27.31,21.08) v1(28.32,0.76) v1(28.83,21.72) v1(31.21,54.99) v1(32.19,0.76) v1(32.36,52.36) v1(32.36,48.36) v1(32.36,36.36) v1(32.36,32.36) v1(33.96,21.72) v1(34.02,1.14) v1(36.37,54.89) v1(36.36,48.36) v1(36.36,40.36) v1(36.36,36.36) v1(36.36,32.36) v1(36.49,28.81) v1(36.83,22.1) v1(37.21,10.03) v1(37.59,29.84) v1(37.9,1.14) v1(38.1,21.46) v1(38.35,31.5) v1(40,32) v1(40,23.37) v1(40.13,25.4) v1(40.36,52.36) v1(40.36,40.36) v1(40.36,36.36) v1(40.7,22.55) v1(40.89,24.38) v1(41.2,1.14) v1(41.49,25.4) v1(41.63,23.37) v1(41.82,54.93) v1(42.01,10.81) v1(42.42,24.38) v1(42.42,22.55) v1(43.05,25.4) v1(43.16,23.37) v1(43.43,10.29) v1(43.98,24.38) v1(44.3,22.61) v1(44.36,52.36) v1(44.36,36.36) v1(44.5,25.4) v1(44.46,1.14) v1(46.23,20.83) v1(46.99,20.07) v1(47.28,53.92) v1(47.76,20.83) v1(47.73,1.14) v1(48.36,52.36) v1(48.36,36.36) v1(48.36,20.36) v1(48.36,8.36) v1(48.36,4.36) v1(50.11,54.93) v1(50.15,45.51) v1(50.15,44.64) v1(50.84,1.14) v1(51.06,45.6) v1(52.03,45.65) v1(52.88,53.92) v1(52.87,45.65) v1(53.34,26.42) v1(53.64,45.65) v1(54.1,32) v1(54.1,30.63) v1(54.29,45.5) v1(54.29,44.64) v1(54.61,1.14) v1(55.86,30.63) v1(56.01,53.97) v1(56.13,26.54) v1(56.31,49.67) v1(56.36,8.36) v1(57.27,49.67) v1(58.55,35.18) v1(58.55,34.16) v1(58.68,49.67) v1(58.67,1.14) v1(60.36,4.36) v1(61.09,24.64) v1(61.34,48.64) v1(61.33,22.63) v1(61.59,44.07) v1(62.23,48.64) v1(62.39,8.48) v1(62.56,1.14) v1(62.99,20.19) v1(63.88,45.72) v1(63.88,44.11) v1(63.88,42.53) v1(63.88,40.89) v1(63.88,39.12) v1(64.13,18.54) v1(64.82,48.64) v1(65.53,45.72) v1(65.65,48.64) v1(65.92,39.12) v1(65.85,1.14) v1(66.29,37.08) v1(66.5,48.64) v1(66.8,27.81) v1(67.04,20.19) v1(67.29,45.72) v1(67.36,48.64) v1(67.69,39.12) v1(68.19,48.64) v1(69.02,45.72) v1(69.04,48.64) v1(69.09,37.97) v1(69.12,1.14) v1(69.68,39.12) v1(69.9,48.64) v1(70.69,45.72) v1(70.69,44.11) v1(70.69,42.53) v1(70.69,40.9) v1(70.73,48.64) v1(71.58,48.64) v1(71.78,39.12) v1(72.15,45.72) v1(72.14,44.15) v1(72.14,42.58) v1(72.14,40.94) v1(72.36,20.36) v1(72.39,1.14) v1(72.56,48.62) v1(73.01,44.33) v1(73.01,40.33) v1(73.12,3.47) v1(73.15,47.62) v1(73.28,45.97) v1(74.26,7.21) v1(76.36,28.36) v1(76.36,20.36) v1(76.36,16.36) v1(76.36,12.36) v1(76.36,8.36) v1(78.99,33.91) v1(78.99,30.64) v1(78.99,27.54) v1(78.99,24.27) v1(78.99,21) v1(78.99,17.71) v1(78.99,13.82) v1(78.99,9.76) v1(78.99,5.99)
ACTLED: length 4.1
  Top Layer w0.254: R34.2 23.49,6.1 RJ1.14
CGND: length 23.4
  Top Layer w1: v1(24.38,20.45) 25.6,20.45 C16.1
  Bottom Layer w1: v1(24.38,20.45) 24.38,14.79 RJ1.GND2 RJ1.GND1
CHIP_PU: length 30.2
  Top Layer w0.254: U1.45 74.82,48.62 75.69,47.75 75.69,35.56 73.42,33.29 73.42,25.28 SW1.1 75.21,23.49 C43.2 75.21,21.18 R4.1
GPIO0: length 35.7
  Top Layer w0.254: v1(62.23,44.93) 62.23,44.96 61.09,46.1 60.36,46.1 U1.4 ; v1(77.98,35.94) 77.98,30.23 77.11,29.36 SW2.1
  Bottom Layer w0.254: v1(77.98,35.94) 77.98,37.82 ; SW2.1 72.37,29.36 62.87,38.86 62.87,44.29 v1(62.23,44.93)
GPIO21: length 43.6
  Top Layer w0.2: CN7.5 54.53,5.87 54.53,5.24 54.52,5.24 54.67,5.1 55.58,5.1 58.2,7.71 67.88,7.71 68.07,7.89 CN3.5 v1(68.07,20.45) ; v1(68.07,31.37) 69.01,32.31 69.01,35.65
  Bottom Layer w0.2: v1(68.07,31.37) v1(68.07,20.45)
GPIO26: length 47.4
  Top Layer w0.2: v1(68.7,20) 68.37,19.67 68.37,12.93 70,11.3 70,10.64 69.27,9.91 CN3.11 69.27,7.93 68.74,7.41 58.34,7.41 55.63,4.7 53.97,4.7 53.43,5.24 53.43,5.87 CN7.11
  Top Layer w0.254: 69.86,35.65 69.86,32.02 v1(68.7,30.86)
  Bottom Layer w0.2: v1(68.7,20) v1(68.7,30.86)
GPIO33: length 52.1
  Top Layer w0.2: v1(69.71,18.85) 69,18.15 69,13.16 70.6,11.55 70.6,10.39 70.07,9.86 CN3.15 70.07,7.88 68.99,6.8 58.59,6.8 57.71,5.93 57.71,3.62 57.21,3.12 54.7,3.12 52.82,4.99 52.82,5.02 52.72,5.12 52.72,5.15 52.63,5.24 52.63,5.87 CN7.15
  Top Layer w0.254: 71.56,35.65 71.56,31.49 v1(70.07,30)
  Bottom Layer w0.2: v1(70.07,30) 69.71,29.64 69.71,19.64 69.73,19.61 69.73,19.13 69.71,19.1 v1(69.71,18.85)
GPIO34: length 56.4
  Top Layer w0.2: v1(69.85,18.03) 69.3,17.49 69.3,13.28 70.91,11.68 70.91,10.27 70.37,9.73 70.37,9.28 70.52,9.14 70.52,8.61 CN3.17 70.47,7.14 70.87,6.74 71.88,6.74 72.02,6.6 72.02,6.4 72.02,6.4 72.02,5.24 69.89,3.12 57.64,3.12 57.34,2.82 54.57,2.82 52.52,4.87 52.52,4.9 52.42,4.99 52.42,5.02 52.32,5.12 52.32,5.15 52.23,5.24 52.23,5.75 52.13,5.84
  Top Layer w0.254: v1(70.8,29.53) 72.41,31.13 72.41,35.65
  Bottom Layer w0.2: v1(70.8,29.53) 70.23,28.96 70.23,19.15 70.29,19.09 70.29,18.48 v1(69.85,18.03)
GPIO47: length 48.7
  Top Layer w0.2: CN7.13 53.03,5.87 53.03,5.24 53.12,5.15 53.12,5.12 53.85,4.4 55.75,4.4 58.46,7.11 68.87,7.11 69.67,7.91 CN3.13 69.67,9.88 70.3,10.52 70.3,11.43 68.7,13.03 68.7,18.92 v1(69.15,19.37)
  Top Layer w0.254: 70.71,35.65 70.71,31.72 v1(69.34,30.35)
  Bottom Layer w0.2: v1(69.15,19.37) 69.34,19.56 v1(69.34,30.35)
GPIO48: length 57.5
  Top Layer w0.2: v1(69.86,17.08) 69.61,16.82 69.61,13.45 71.21,11.85 71.21,10.14 70.87,9.8 CN3.19 70.87,7.42 71.12,7.17 72.01,7.17 72.33,6.85 72.33,5.25 72.32,5.25 72.32,5.12 70.02,2.82 57.77,2.82 57.46,2.51 54.45,2.51 52.22,4.74 52.22,4.77 52.12,4.87 52.12,4.9 52.02,4.99 52.02,5.02 51.92,5.12 51.92,5.15 51.83,5.24 51.83,5.87 CN7.19
  Top Layer w0.254: 73.26,35.65 73.26,33.63 73.06,33.43 73.06,30.54 v1(71.55,29.03)
  Bottom Layer w0.2: v1(71.55,29.03) 70.59,28.07 70.59,19.3 70.65,19.24 70.65,17.86 v1(69.86,17.08)
INTN: length 2.6
  Top Layer w0.254: 62.21,35.65 62.21,35.16 61.28,34.23 R29.2
IO_5_TEMP1: length 36.6
  Top Layer w0.254: v1(59.44,41.02) 59.49,40.97 U1.10 ; v1(60.32,23.75) 58.29,21.72 58.29,18.03 56.84,16.58 56.84,15.37 56.77,15.29 v1(56.77,14.35)
  Bottom Layer w0.254: 59.86,8.47 57.74,10.59 57.74,11.33 56.77,12.3 v1(56.77,14.35) ; v1(60.32,23.75) 59.44,24.64 v1(59.44,41.02)
IO_BUZZER: length 15.4
  Top Layer w0.254: U1.12 60.36,39.24 v1(61.21,39.24) ; v1(63.25,26.42) 63.32,26.49 R11.2
  Bottom Layer w0.254: v1(61.21,39.24) 61.21,28.32 63.12,26.42 v1(63.25,26.42)
IO_LED: length 2.4
  Top Layer w0.254: U1.8 R1.2
IO_USBD+: length 61.1
  Top Layer w0.254: v1(68.16,37.21) 68.16,34.99 67.94,34.77 67.94,33.2 56.54,21.8 56.54,19.14 49.19,11.79 42.16,11.79 40.97,10.59 40.97,9.57 40.37,8.98 D4.1 40.4,8.84 USB1.8 40.39,7.38 40.39,6.6 40.13,6.35 39.62,6.35 39.4,6.58 USB1.6
  Bottom Layer w0.254: v1(68.16,37.21) 68.56,36.82 68.56,36.3 68.74,36.12 71.42,36.12 77.09,41.78 77.09,42.03 v1(77.48,42.43)
IO_USBD-: length 61.2
  Top Layer w0.254: v1(67.31,36.45) 67.31,34.99 67.53,34.77 67.53,33.37 56.13,21.97 56.13,19.3 49.02,12.19 40.64,12.19 39.75,11.3 39.75,9.55 39.23,9.03 D3.1 ; D3.1 39.9,8.2 USB1.7 ; D3.1 38.9,8.53 USB1.5
  Bottom Layer w0.254: v1(78.02,40.57) 77.38,41.21 77.1,41.21 71.59,35.71 68.57,35.71 68.22,36.05 67.71,36.05 v1(67.31,36.45)
LINKLED: length 15.3
  Top Layer w0.254: RJ1.12 13.92,4.95 R35.2
MISO: length 2.5
  Top Layer w0.254: R31.2 58.61,36.51 58.82,36.72 U1.15
MOSI: length 2.7
  Top Layer w0.254: 61.36,35.65 61.36,35.2 60.13,33.97 R30.2
POE+: length 15.1
  Top Layer w0.254: 7.24,27.18 7.37,27.3 R37.2 ; C30.2 20.12,28.58 R46.2
  Top Layer w1: D8.1 12.54,21.72 19.18,21.72 20.42,20.48 RJ1.9
POE-: length 30.6
  Top Layer w0.254: C30.1 20.45,29.66
  Top Layer w0.5: R39.1 v1(8.58,29.01) R38.1 ; R45.1 20.45,26.92 20.96,27.43 20.96,29.15 C30.1 ; v1(10.03,26.29) 10.41,25.91 U4.4 14.22,25.91 U4.9
  Top Layer w1: RJ1.10 22.1,17.84 22.1,21.21 19.94,23.37 15.49,23.37 14.35,24.51 v3(14.35,25.66) 14.35,27.69 U4.9
  Bottom Layer w0.5: v1(8.58,29.01) 8.58,27.74 v1(10.03,26.29)
  vias: v3(13.21,25.65) v3(13.21,24.62) v3(13.21,23.58) v3(15.37,25.66) v3(20.57,30.86) v3(21.72,31.37) v3(21.72,30.22) v3(21.72,28.95) v3(21.72,27.57)
POE_PG: length 28.2
  Top Layer w0.254: 17.35,27.3 17.71,27.3 18.85,26.16 22.1,26.16 23.11,27.18 23.11,31.11 24,32 27.15,32 27.81,32.67 27.81,41.66 28.83,42.67 U5.3
RSTN: length 2.5
  Top Layer w0.254: 63.06,35.65 63.06,34.99 62.36,34.29 R28.2
RX+: length 24.2
  Top Layer w0.254: C14.2 23.77,7.72 23.24,8.25 16.76,8.25 10.26,14.76 RJ1.1
RX-: length 20.4
  Top Layer w0.254: C13.2 24.49,10.01 23.5,9.02 17.02,9.02 11.53,14.51 RJ1.2
RX_N: length 2.4
  Top Layer w0.254: U3.5 41.67,18.96 R13.2
RX_P: length 2.2
  Top Layer w0.254: U3.6 42.17,18.59 R14.2
RXCT: length 24.1
  Top Layer w0.254: v1(25.65,11.15) R12.1 26.25,12.34 26.35,12.45 ; 26.35,12.45 23.24,12.45 22.48,13.21 15.37,13.21 12.8,15.78 RJ1.3 ; 26.35,12.45 C12.2 ; R20.1 v1(25.65,8.86)
  Bottom Layer w0.254: v1(25.65,11.15) v1(25.65,8.86)
SCL_1: length 34.6
  Top Layer w0.254: R2.2 v1(65.53,34.04) 65.61,34.11 65.61,35.65
  Bottom Layer w0.254: 72.12,5.47 72.11,5.46 70.36,5.46 70,5.82 70,11.41 68.96,12.45 68.96,14.22 65.79,17.4 65.79,33.78 v1(65.53,34.04)
SCLK: length 2.4
  Top Layer w0.254: R32.2 58.05,37.57 U1.14
SCSN: length 2.5
  Top Layer w0.254: R33.2 58.61,38.8 58.99,38.42 U1.13
SDA_1: length 32.8
  Top Layer w0.254: 64.76,35.65 64.76,34.66 v1(64.13,34.04) 64.13,33.58 R3.2 ; v1(64.39,19.81) 66.42,19.81 v1(67.06,19.18)
  Bottom Layer w0.254: 72.12,8.47 70.99,9.6 70.54,9.6 70.36,9.78 70.36,11.64 70.34,11.65 70.34,11.83 69.32,12.85 69.32,14.37 67.06,16.63 v1(67.06,19.18) ; v1(64.39,19.81) 64.39,33.78 v1(64.13,34.04)
TX+: length 24.9
  Top Layer w0.254: R16.1 29.84,19.56 27.81,17.53 26.54,17.53 26.25,17.23 R17.1 25.27,16.76 24.38,15.87 16.26,15.87 15.34,16.8 RJ1.5
TX-: length 20.5
  Top Layer w0.254: RJ1.6 17.65,16.38 23.24,16.38 25.15,18.29 R18.1 ; R15.1 28.32,20.7 26.25,18.63 26.25,18.41
TX_N: length 4
  Top Layer w0.254: U3.1 39.61,20.7 R15.2
TX_P: length 5.3
  Top Layer w0.254: R16.2 39.88,19.56 40.17,19.85 U3.2
TXCT: length 15.7
  Top Layer w0.254: RJ1.4 14.07,16.67 15.32,15.42 24.59,15.42 25.78,14.22 C15.2 26.24,14.46 R19.1
USB_CC1: length 1.9
  Top Layer w0.254: USB1.4 38.4,8.87 R6.2
USB_CC2: length 1.8
  Top Layer w0.254: R5.2 41.4,9.06 USB1.10
UVLO: length 3.3
  Top Layer w0.254: 17.35,28.57 17.48,28.45 18.87,28.45 R46.1 R45.2
XI: length 8.3
  Top Layer w0.254: X1.1 44.32,34.63 C28.2 45.72,32.88 44.21,31.37 R36.1 43.36,31.04 42.67,30.35 U3.30
XO: length 6.1
  Top Layer w0.254: C29.2 41.39,33.24 X1.3 41.7,32.16 R36.2 42.17,31.04 U3.31
$1N1524: length 14.1
  Top Layer w0.254: v1(55.5,45.85) 55.5,49.91 52.58,52.83 51.69,52.83 51.38,53.14 LED4.4 ; R1.1 v1(57.1,43.43)
  Bottom Layer w0.254: v1(55.5,45.85) 55.5,45.03 v1(57.1,43.43)
$1N1525: length 10.7
  Top Layer w0.254: LED3.2 48.49,48.92 45.97,51.43 42.46,51.43 40.33,53.56 LED2.4
$1N1526: length 11.1
  Top Layer w0.254: LED3.4 45.79,53.52 47.88,51.43 52.22,51.43 54.36,49.3 54.36,48.94 LED4.2
$1N1538: length 11.4
  Top Layer w0.254: LED1.4 34.88,52.75 37.47,50.16 42.44,50.16 43.33,49.28 43.33,48.92
$2N1611: length 18.6
  Top Layer w0.254: R13.1 41.16,16.78 40.64,16.26 35.05,16.26 28.8,10.01 C13.1 27.45,10.81 R12.2
$2N1790: length 20.7
  Top Layer w0.254: R14.1 42.3,16.78 41.15,15.62 35.56,15.62 27.66,7.72 C14.1 27.45,8.53 R20.2
$2N2662: length 2.4
  Top Layer w0.254: U3.10 44.17,18.88 R21.2
$2N2992: length 4.5
  Top Layer w0.254: U3.20 47.64,25.64 48.13,25.15 48.13,24.38 49.28,23.24 C17.2
$2N3059: length 3.3
  Top Layer w0.254: C18.2 49.02,26.03 48.41,26.64 U3.22
$2N3068: length 4
  Top Layer w0.254: R22.1 36.19,22.86 36.58,23.24 36.58,24.26 37.46,25.14 U3.42
$2N3219: length 3.2
  Top Layer w0.254: U3.41 37.2,25.64 35.74,24.18 R23.1
$2N3258: length 2.8
  Top Layer w0.254: R24.1 35.81,25.15 36.81,26.14 U3.40
$2N3297: length 2.6
  Top Layer w0.254: R25.1 36.07,26.29 36.42,26.64 U3.39
$2N3336: length 2.5
  Top Layer w0.254: U3.38 36.49,27.14 36.19,27.43 R26.1
$2N3426: length 2.9
  Top Layer w0.254: U3.23 47.84,27.14 48.13,27.43 R27.2
$2N3529: length 54.7
  Top Layer w0.254: R34.1 35.88,14.73 49.91,14.73 54.23,19.05 v1(54.23,24.64) ; U3.27 44.17,29.94 46.35,32.13 v1(47.5,32.13)
  Bottom Layer w0.254: v1(47.5,32.13) 48.9,30.73 51.44,30.73 54.23,27.94 v1(54.23,24.64)
$2N3533: length 55.8
  Top Layer w0.254: v1(49.4,31.5) 46.61,31.5 45.17,30.05 U3.25 ; v1(55.37,25.53) 55.37,19.43 49.91,13.97 36.26,13.97 R35.1
  Bottom Layer w0.254: v1(55.37,25.53) 54.99,25.91 54.99,28.07 51.44,31.62 49.53,31.62 v1(49.4,31.5)
$2N3654: length 29.6
  Top Layer w0.254: v1(37.02,27.75) 37.13,27.64 U3.37 ; 62.36,32.59 57.2,27.43 v1(52.2,27.43)
  Bottom Layer w0.254: v1(37.02,27.75) 38.35,26.42 47.37,26.42 48.39,27.43 v1(52.2,27.43)
$2N3698: length 26
  Top Layer w0.254: v1(39.75,27.05) 39.67,27.13 U3.36 ; v1(48.13,28.19) 56.9,28.19 61.28,32.58 61.28,32.59
  Bottom Layer w0.254: v1(39.75,27.05) 46.99,27.05 v1(48.13,28.19)
$2N3739: length 23.1
  Top Layer w0.254: v1(46.99,28.83) 56.52,28.83 60.13,32.45 60.13,32.59 ; U3.35 40.17,28.28 v1(40.64,27.81)
  Bottom Layer w0.254: v1(40.64,27.81) 45.97,27.81 v1(46.99,28.83)
$2N3780: length 26.1
  Top Layer w0.254: v1(48.26,29.46) 51.18,29.46 53.09,31.37 53.09,33.02 56.58,36.51 R31.1 ; v1(38.74,30.23) 40.28,30.23 40.67,29.84 U3.34
  Bottom Layer w0.254: v1(48.26,29.46) 46.36,29.46 45.47,28.57 40.39,28.57 v1(38.74,30.23)
$2N3821: length 25.6
  Top Layer w0.254: v1(39.5,30.86) 40.26,30.86 41.17,29.95 U3.33 ; R32.1 56.58,37.66 52.32,33.4 52.32,31.88 50.55,30.1 v1(46.99,30.1)
  Bottom Layer w0.254: v1(46.99,30.1) 46.16,30.1 45.27,29.21 41.02,29.21 39.5,30.73 v1(39.5,30.86)
$2N3862: length 24.1
  Top Layer w0.254: v1(47.75,30.73) 49.91,30.73 51.69,32.51 51.69,34.16 56.32,38.8 R33.1 ; v1(40.77,31.24) 41.67,30.34 U3.32
  Bottom Layer w0.254: v1(40.77,31.24) 42.16,29.84 44.96,29.84 45.85,30.73 v1(47.75,30.73)
$2N11478: length 1.8
  Top Layer w0.254: U4.1 9.58,29.72 R38.2
$2N11487: length 1.8
  Top Layer w0.254: U4.3 11.1,27.3 R37.1
$2N13890: length 1.5
  Top Layer w0.254: 26.42,53.38 27.85,53.38 R41.1
$2N13898: length 2.9
  Top Layer w0.254: U5.6 28.83,53.26 R41.2
$2N14130: length 1.6
  Top Layer w0.254: U5.4 30.1,43 R42.2
$2N14327: length 2.6
  Top Layer w0.254: U5.1 26.29,43.69 25.78,43.18 C36.2
$2N14331: length 6.1
  Top Layer w0.254: C36.1 23.62,43.22 v1(23.62,43.81)
  Bottom Layer w0.254: v1(23.62,43.81) 22.6,44.84 v1(22.6,48.87)
$2N14631: length 2.9
  Top Layer w0.254: R43.2 R44.2 30.17,50.57 U5.5
$2N19568: length 1.8
  Top Layer w0.254: U4.2 R39.2
$3N1809: length 1.6
  Top Layer w0.254: 64.01,27.36 64.54,27.89 Q3.1
$3N1812: length 7.2
  Top Layer w0.5: BUZZER1.2 65.46,23.68 66.8,25.02 66.8,26.54 67.2,26.94 Q3.3 68.52,26.94 D7.2

## Copper pours and planes (outline as drawn; the poured copper is in the pictures)
+3V3_CTRL on Top Layer: 37.21,46.48 45.47,46.48 45.47,43.05 37.21,43.05
+3V3_CTRL on Top Layer: 43.05,45.72 53.78,45.72 53.78,37.34 43.05,37.34
+5VA on Top Layer: 3.17,53.59 18.16,53.59 18.16,41.02 3.17,41.02
AGND on Top Layer: 16.38,30.23 28.32,30.23 28.32,21.84 16.38,21.84
AGND on Top Layer: 3.17,48.77 29.84,48.77 29.84,33.02 3.17,33.02
AGND on Bottom Layer: 9.91,37.21 28.32,37.21 28.32,26.29 9.91,26.29
GND on Top Layer: 94.87,63.12 177.16,63.12 177.16,3.43 94.87,3.43
GND on Top Layer: 48.39,45.97 54.74,45.97 54.74,43.31 48.39,43.31
GND on Bottom Layer: 92.46,67.56 176.4,67.56 176.4,8 92.46,8
POE+ on Top Layer: 5.46,44.96 27.94,44.96 27.94,22.51 5.46,22.51
POE- on Top Layer: 19.84,32.26 22.61,32.26 22.61,26.67 19.84,26.67
POE- on Top Layer: 12.7,29.59 15.8,29.59 15.8,22.89 12.7,22.89
POE- on Bottom Layer: 12.69,32.26 22.61,32.26 22.61,22.9 12.69,22.9
$2N14331 on Top Layer: 17.91,53.59 26.65,53.59 26.65,46.48 17.91,46.48

Small or netless copper shapes (teardrops, artwork), in the pictures only: 356 on Top Layer, 44 on Bottom Layer

## Text on the board
Bottom Silkscreen Layer: 2025.4.1 | TEMP_PRO-1 REV-6
Top Silkscreen Layer: BOOT | RST | X
